# Altium project PCB_TEAM07_SMT.PrjPcb
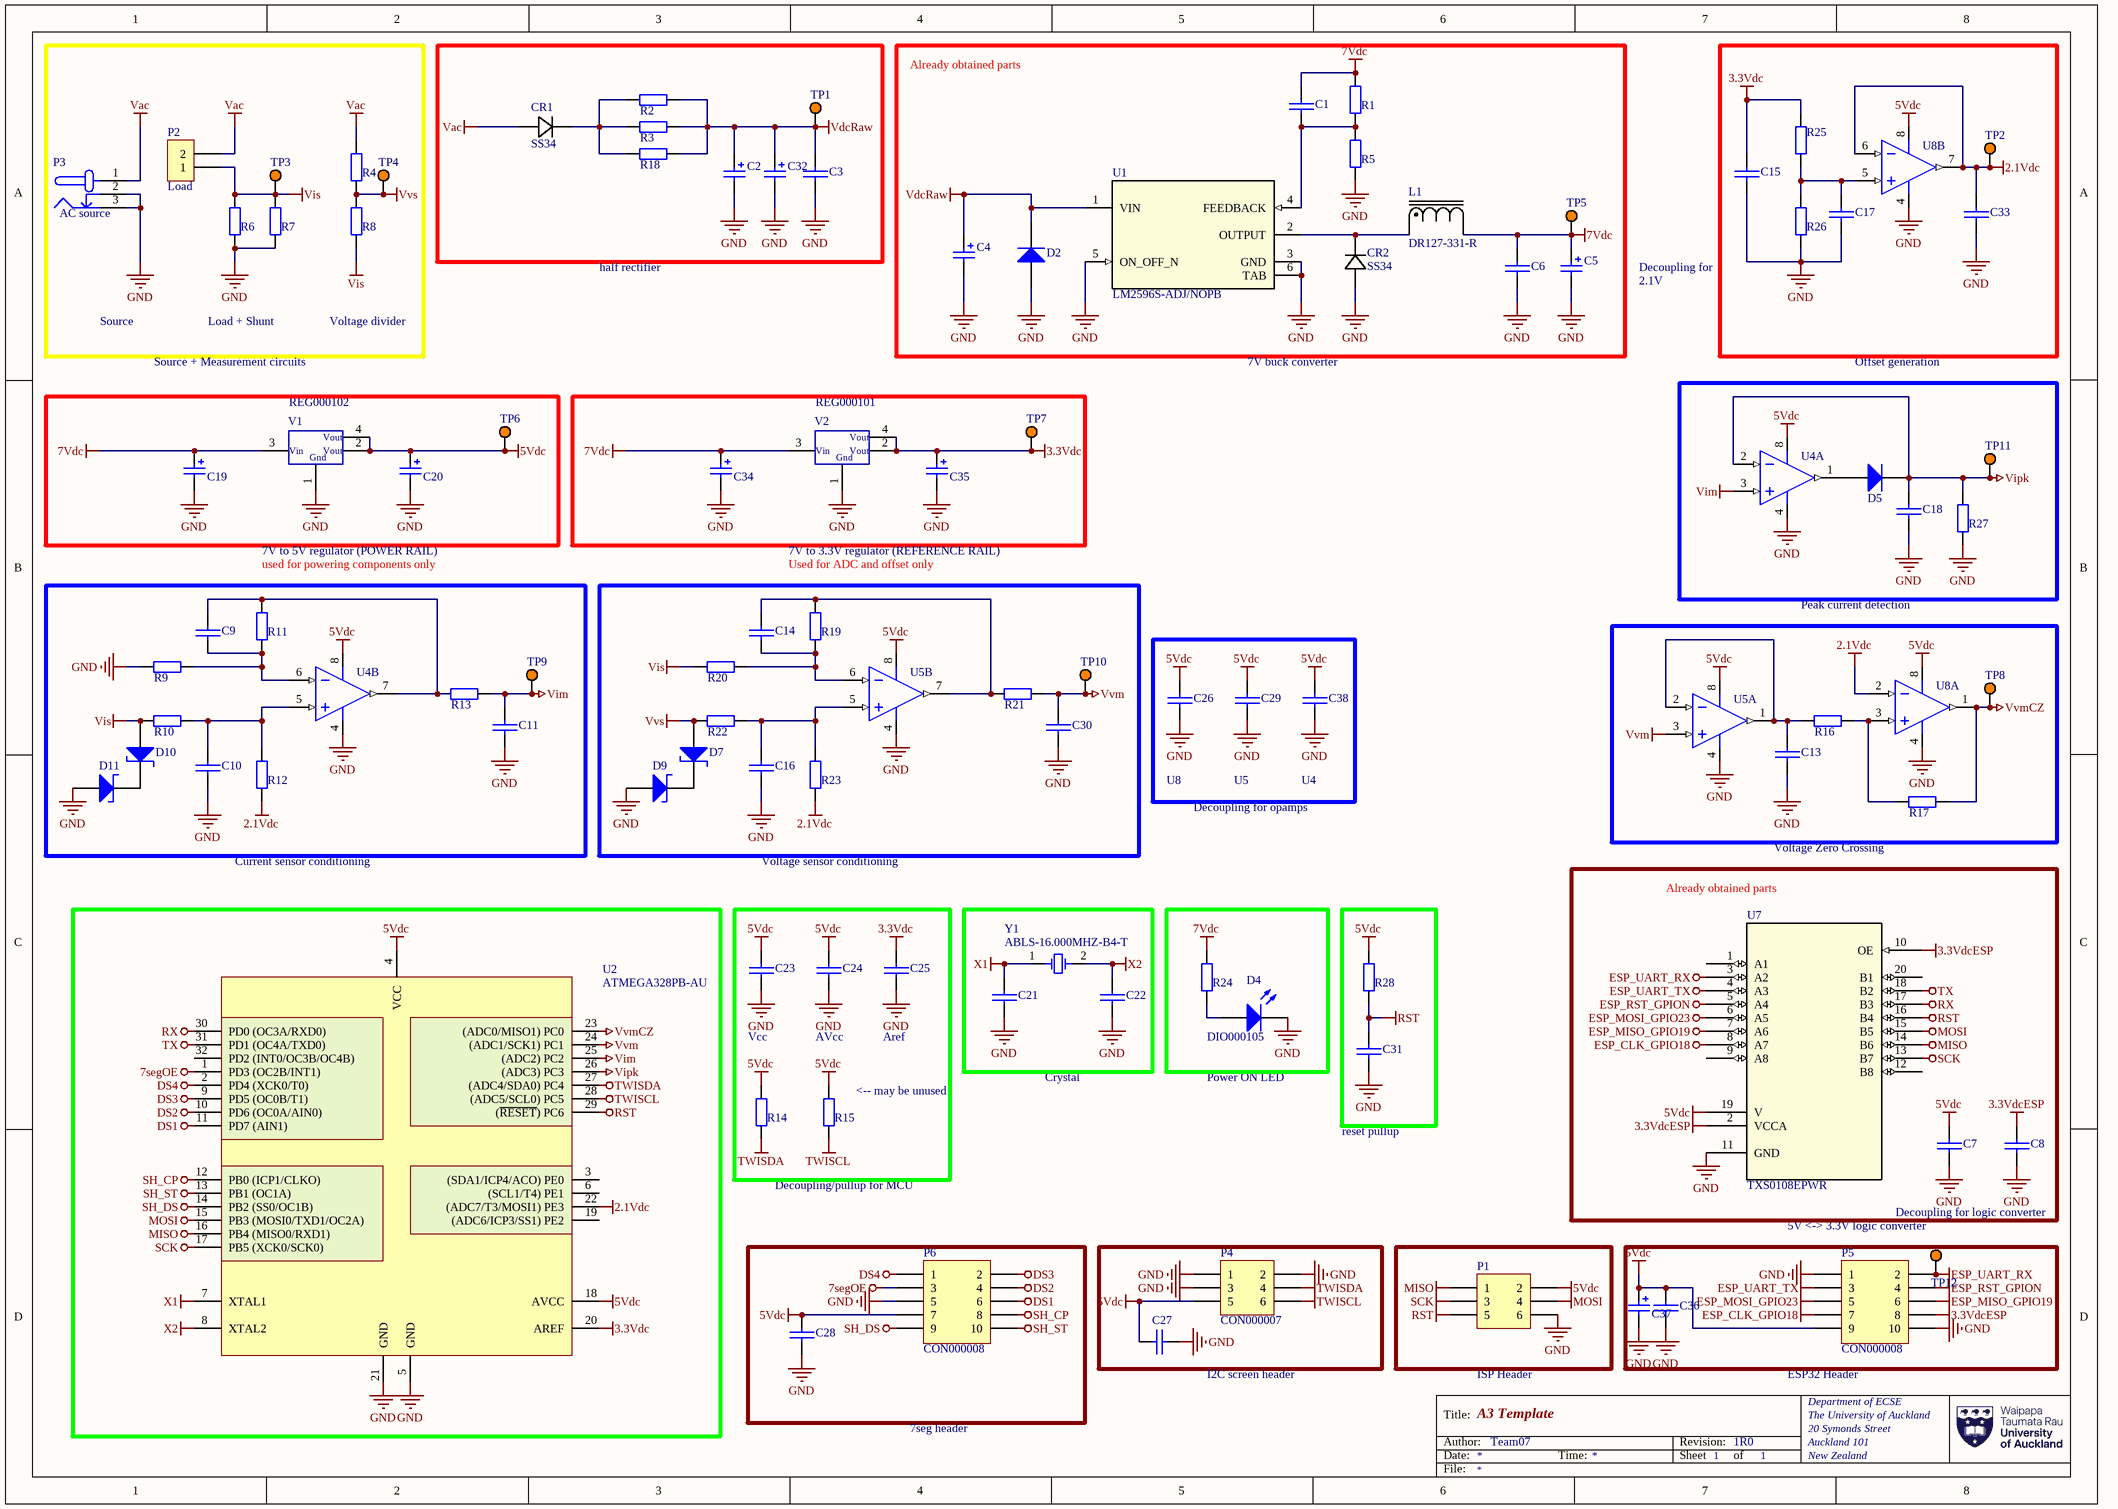
[diagram p0: PCB_TEAM07_SMT_Sch.SchDoc]
1 sheet, 102 parts. Net scope: global (net labels, ports and power ports of the same name join across sheets).
Board file: PCB_TEAM07_SMT_PCB.PcbDoc

## Sheet PCB_TEAM07_SMT_Sch.SchDoc: A3 Template
size A3; Author: Team07; CompanyName: The University of Auckland; Organization: Department of ECSE; Address1: 20 Symonds Street; Address2: Auckland 101; Address3: New Zealand; Revision: 1R0; SheetNumber: 1; SheetTotal: 1

### Parts
C1  CAP000520  [ECE-CAPC2012-0805SM]  (value not drawn)
C2  CAP000307  [ECE-CAPAE10X10.2SM]  (value not drawn)
C3  CAP000524  [ECE-CAPC2012-0805SM]  (value not drawn)
C4  CAP000307  [ECE-CAPAE10X10.2SM]  (value not drawn)
C5  CAP000307  [ECE-CAPAE10X10.2SM]  (value not drawn)
C6  CAP000524  [ECE-CAPC2012-0805SM]  (value not drawn)
C7  CAP000524  [ECE-CAPC2012-0805SM]  (value not drawn)
C8  CAP000524  [ECE-CAPC2012-0805SM]  (value not drawn)
C9  CAP000524  [ECE-CAPC2012-0805SM]  (value not drawn)
C10  CAP000524  [ECE-CAPC2012-0805SM]  (value not drawn)
C11  CAP000524  [ECE-CAPC2012-0805SM]  (value not drawn)
C13  CAP000524  [ECE-CAPC2012-0805SM]  (value not drawn)
C14  CAP000524  [ECE-CAPC2012-0805SM]  (value not drawn)
C15  CAP000524  [ECE-CAPC2012-0805SM]  (value not drawn)
C16  CAP000524  [ECE-CAPC2012-0805SM]  (value not drawn)
C17  CAP000524  [ECE-CAPC2012-0805SM]  (value not drawn)
C18  CAP000524  [ECE-CAPC2012-0805SM]  (value not drawn)
C19  CAP000305  [ECE-CAPAE6.3X5.4SM]  (value not drawn)
C20  CAP000305  [ECE-CAPAE6.3X5.4SM]  (value not drawn)
C21  CAP000524  [ECE-CAPC2012-0805SM]  (value not drawn)
C22  CAP000524  [ECE-CAPC2012-0805SM]  (value not drawn)
C23  CAP000524  [ECE-CAPC2012-0805SM]  (value not drawn)
C24  CAP000524  [ECE-CAPC2012-0805SM]  (value not drawn)
C25  CAP000524  [ECE-CAPC2012-0805SM]  (value not drawn)
C26  CAP000524  [ECE-CAPC2012-0805SM]  (value not drawn)
C27  CAP000524  [ECE-CAPC2012-0805SM]  (value not drawn)
C28  CAP000524  [ECE-CAPC2012-0805SM]  (value not drawn)
C29  CAP000524  [ECE-CAPC2012-0805SM]  (value not drawn)
C30  CAP000524  [ECE-CAPC2012-0805SM]  (value not drawn)
C31  CAP000524  [ECE-CAPC2012-0805SM]  (value not drawn)
C32  CAP000307  [ECE-CAPAE10X10.2SM]  (value not drawn)
C33  CAP000524  [ECE-CAPC2012-0805SM]  (value not drawn)
C34  CAP000305  [ECE-CAPAE6.3X5.4SM]  (value not drawn)
C35  CAP000305  [ECE-CAPAE6.3X5.4SM]  (value not drawn)
C36  CAP000524  [ECE-CAPC2012-0805SM]  (value not drawn)
C37  CAP000305  [ECE-CAPAE6.3X5.4SM]  (value not drawn)
C38  CAP000524  [ECE-CAPC2012-0805SM]  (value not drawn)
CR1  SS34  [DO-214ACSMA2_MDD]
CR2  SS34  [DO-214ACSMA2_MDD]
D2  DIO000102  [ECE-DO214ACSM]  (value not drawn)
D4  DIO000105  [ECE-LED2012-0805SM]
D5  DIO000102  [ECE-DO214ACSM]  (value not drawn)
D7  ZEN000018  [ECE-DIO-SOD123SM]  (value not drawn)
D9  ZEN000018  [ECE-DIO-SOD123SM]  (value not drawn)
D10  ZEN000018  [ECE-DIO-SOD123SM]  (value not drawn)
D11  ZEN000018  [ECE-DIO-SOD123SM]  (value not drawn)
L1  DR127-331-R  [DR127]
P1  CON000007  [ECE-BHDR2X3TH]  (value not drawn)
P2  AC_Output  [Dual Banana Connector-Footprint-1]  (value not drawn)
P3  AC_Input  [Barrel Jack-Footprint-1]  (value not drawn)
P4  CON000007  [ECE-BHDR2X3TH]
P5  CON000008  [ECE-BHDR-2X5TH]
P6  CON000008  [ECE-BHDR-2X5TH]
R1  RES000501  [ECE-RESC2012-0805SM]  (value not drawn)
R2  RES000501  [ECE-RESC2012-0805SM]  (value not drawn)
R3  RES000501  [ECE-RESC2012-0805SM]  (value not drawn)
R4  RES000501  [ECE-RESC2012-0805SM]  (value not drawn)
R5  RES000501  [ECE-RESC2012-0805SM]  (value not drawn)
R6  RES000501  [ECE-RESC2012-0805SM]  (value not drawn)
R7  RES000501  [ECE-RESC2012-0805SM]  (value not drawn)
R8  RES000501  [ECE-RESC2012-0805SM]  (value not drawn)
R9  RES000501  [ECE-RESC2012-0805SM]  (value not drawn)
R10  RES000501  [ECE-RESC2012-0805SM]  (value not drawn)
R11  RES000501  [ECE-RESC2012-0805SM]  (value not drawn)
R12  RES000501  [ECE-RESC2012-0805SM]  (value not drawn)
R13  RES000501  [ECE-RESC2012-0805SM]  (value not drawn)
R14  RES000501  [ECE-RESC2012-0805SM]  (value not drawn)
R15  RES000501  [ECE-RESC2012-0805SM]  (value not drawn)
R16  RES000501  [ECE-RESC2012-0805SM]  (value not drawn)
R17  RES000501  [ECE-RESC2012-0805SM]  (value not drawn)
R18  RES000501  [ECE-RESC2012-0805SM]  (value not drawn)
R19  RES000501  [ECE-RESC2012-0805SM]  (value not drawn)
R20  RES000501  [ECE-RESC2012-0805SM]  (value not drawn)
R21  RES000501  [ECE-RESC2012-0805SM]  (value not drawn)
R22  RES000501  [ECE-RESC2012-0805SM]  (value not drawn)
R23  RES000501  [ECE-RESC2012-0805SM]  (value not drawn)
R24  RES000501  [ECE-RESC2012-0805SM]  (value not drawn)
R25  RES000501  [ECE-RESC2012-0805SM]  (value not drawn)
R26  RES000501  [ECE-RESC2012-0805SM]  (value not drawn)
R27  RES000501  [ECE-RESC2012-0805SM]  (value not drawn)
R28  RES000501  [ECE-RESC2012-0805SM]  (value not drawn)
TP1  Test_Point_TH  [Test-Pin-TH]  (value not drawn)
TP2  Test_Point_TH  [Test-Pin-TH]  (value not drawn)
TP3  Test_Point_TH  [Test-Pin-TH]  (value not drawn)
TP4  Test_Point_TH  [Test-Pin-TH]  (value not drawn)
TP5  Test_Point_TH  [Test-Pin-TH]  (value not drawn)
TP6  Test_Point_TH  [Test-Pin-TH]  (value not drawn)
TP7  Test_Point_TH  [Test-Pin-TH]  (value not drawn)
TP8  Test_Point_TH  [Test-Pin-TH]  (value not drawn)
TP9  Test_Point_TH  [Test-Pin-TH]  (value not drawn)
TP10  Test_Point_TH  [Test-Pin-TH]  (value not drawn)
TP11  Test_Point_TH  [Test-Pin-TH]  (value not drawn)
TP12  Test_Point_TH  [Test-Pin-TH]  (value not drawn)
U1  LM2596S-ADJ/NOPB  [KTT0005B]
U2  ATMEGA328PB-AU  [TQFP-32]
U4  TLC082CDR  [SOIC8-Ti-Footprint]  (value not drawn)  (parts A,B of 2)
U5  TLC082CDR  [SOIC8-Ti-Footprint]  (value not drawn)  (parts A,B of 2)
U7  TXS0108EPWR  [PW20]
U8  TLC082CDR  [SOIC8-Ti-Footprint]  (value not drawn)  (parts A,B of 2)
V1  REG000102  [ECE-SOT223SM]
V2  REG000101  [ECE-SOT223SM]
Y1  ABLS-16.000MHZ-B4-T  [HC49-U-Crystal]

### Blocks framed on the sheet
Already obtained parts: C1 C4-C6 CR2 D2 L1 R1 R5 TP5 U1
Offset generation: C18 D5 R27 TP11 U4
used for powering components only: C9-C11 D10 D11 R9-R13 TP9 U4
Used for ADC and offset only: C14 C16 C30 D7 D9 R19-R23 TP10 U5
Peak current detection: C13 R16 R17 TP8 U5 U8
5V <-> 3.3V logic converter: C36 C37 P5 TP12

### Nets
2.1Vdc: C33.1 R12.1 R23.1 TP2.1 U2.22((ADC7/T3/MOSI1)_PE3) U8.2(1IN-) U8.6(2IN-) U8.7(2OUT)
3.3Vdc: C15.1 C25.1 C35.1 R25.1 TP7.1 U2.20(AREF) V2.2(Vout) V2.4(Vout)
3.3VdcESP: C8.1 P5.8 U7.2(VCCA) U7.10(OE)
5Vdc: C7.1 C20.1 C23.1 C24.1 C26.1 C27.1 C28.1 C29.1 C36.1 C37.1 C38.1 P1.2 P4.5 P5.9 P6.7 R14.2 R15.2 R28.2 TP6.1 U2.4(VCC) U2.18(AVCC) U4.8(VCC) U5.8(VCC) U7.19(V) U8.8(VCC) V1.2(Vout) V1.4(Vout)
7segOE: P6.3 U2.1(PD3_(OC2B/INT1))
7Vdc: C1.1 C5.1 C6.1 C19.1 C34.1 L1.2 R1.2 R24.2 TP5.1 V1.3(Vin) V2.3(Vin)
DS1: P6.6 U2.11(PD7_(AIN1))
DS2: P6.4 U2.10(PD6_(OC0A/AIN0))
DS3: P6.2 U2.9(PD5_(OC0B/T1))
DS4: P6.1 U2.2(PD4_(XCK0/T0))
ESP_CLK_GPIO18: P5.7 U7.8(A7)
ESP_MISO_GPIO19: P5.6 U7.7(A6)
ESP_MOSI_GPIO23: P5.5 U7.6(A5)
ESP_RST_GPION: P5.4 U7.5(A4)
ESP_UART_RX: P5.2 TP12.1 U7.3(A2)
ESP_UART_TX: P5.3 U7.4(A3)
GND: C2.2 C3.2 C4.2 C5.2 C6.2 C7.2 C8.2 C10.2 C11.2 C13.2 C15.2 C16.2 C17.2 C18.2 C19.2 C20.2 C21.2 C22.2 C23.2 C24.2 C25.2 C26.2 C27.2 C28.2 C29.2 C30.2 C31.2 C32.2 C33.2 C34.2 C35.2 C36.2 C37.2 C38.2 CR2.2 D2.1(A) D4.2(K) D9.1(A) D11.1(A) P1.6 P3.2(GND_ALT) P3.3(GND) P4.1 P4.2 P4.3 P5.1 P5.10 P6.5 R5.1 R6.2 R7.1 R9.2 R26.1 R27.1 U1.3(GND) U1.5(ON_OFF_N) U1.6(TAB) U2.5(GND) U2.21(GND) U4.4(GND) U5.4(GND) U7.11(GND) U8.4(GND) V1.1(Gnd) V2.1(Gnd)
MISO: P1.1 U2.16(PB4_(MISO0/RXD1)) U7.14(B6)
MOSI: P1.4 U2.15(PB3_(MOSI0/TXD1/OC2A)) U7.15(B5)
RST: C31.1 P1.5 R28.1 U2.29((~{RESET})_PC6) U7.16(B4)
RX: U2.30(PD0_(OC3A/RXD0)) U7.17(B3)
SCK: P1.3 U2.17(PB5_(XCK0/SCK0)) U7.13(B7)
SH_CP: P6.8 U2.12(PB0_(ICP1/CLKO))
SH_DS: P6.9 U2.14(PB2_(SS0/OC1B))
SH_ST: P6.10 U2.13(PB1_(OC1A))
TWISCL: P4.6 R15.1 U2.28((ADC5/SCL0)_PC5)
TWISDA: P4.4 R14.1 U2.27((ADC4/SDA0)_PC4)
TX: U2.31(PD1_(OC4A/TXD0)) U7.18(B2)
Vac: CR1.2 P2.2 P3.1(VCC) R4.2
VdcRaw: C2.1 C3.1 C4.1 C32.1 D2.2(K) R2.1 R3.1 R18.1 TP1.1 U1.1(VIN)
Vim: C11.1 R13.1 TP9.1 U2.25((ADC2)_PC2) U4.3(1IN+)
Vipk: C18.1 D5.2(K) R27.2 TP11.1 U2.26((ADC3)_PC3) U4.2(1IN-)
Vis: D10.1(A) P2.1 R6.1 R7.2 R8.1 R10.2 R20.2 TP3.1
Vvm: C30.1 R21.1 TP10.1 U2.24((ADC1/SCK1)_PC1) U5.3(1IN+)
VvmCZ: R17.1 TP8.1 U2.23((ADC0/MISO1)_PC0) U8.1(1OUT)
Vvs: D7.1(A) R4.1 R8.2 R22.2 TP4.1
X1: C21.1 U2.7(XTAL1) Y1.1(OSC1)
X2: C22.1 U2.8(XTAL2) Y1.2(OSC2)
NetC1_2: C1.2 R1.1 R5.2 U1.4(FEEDBACK)
NetC9_1: C9.1 R11.2 R13.2 U4.7(2OUT)
NetC9_2: C9.2 R9.1 R11.1 U4.6(2IN-)
NetC10_1: C10.1 R10.1 R12.2 U4.5(2IN+)
NetC13_1: C13.1 R16.2 U5.1(1OUT) U5.2(1IN-)
NetC14_1: C14.1 R19.2 R21.2 U5.7(2OUT)
NetC14_2: C14.2 R19.1 R20.1 U5.6(2IN-)
NetC16_1: C16.1 R22.1 R23.2 U5.5(2IN+)
NetC17_1: C17.1 R25.2 R26.2 U8.5(2IN+)
NetCR1_1: CR1.1 R2.2 R3.2 R18.2
NetCR2_1: CR2.1 L1.1 U1.2(OUTPUT)
NetD4_1: D4.1(A) R24.1
NetD5_1: D5.1(A) U4.1(1OUT)
NetD7_2: D7.2(K) D9.2(K)
NetD10_2: D10.2(K) D11.2(K)
NetR16_1: R16.1 R17.2 U8.3(1IN+)

Not connected (* = marked no-connect by the designer): U2 3((SDA1/ICP4/ACO)_PE0) 6((SCL1/T4)_PE1) 19((ADC6/ICP3/SS1)_PE2) 32(PD2_(INT0/OC3B/OC4B)); U7 1(A1) 9(A8) 12(B8) 20(B1)

### Notes on the sheet
- (near P3) AC source
- (near P2) Load
- half rectifier
- Decoupling for
- 2.1V
- Source
- Source + Measurement circuits
- Load + Shunt
- Voltage divider
- 7V buck converter
- 7V to 5V regulator (POWER RAIL)
- 7V to 3.3V regulator (REFERENCE RAIL)
- U8
- U5
- U4
- Decoupling for opamps
- (near R17) Voltage Zero Crossing
- Current sensor conditioning
- Voltage sensor conditioning
- Already obtained parts
- Vcc
- AVcc
- Aref
- (near R15) <-- may be unused
- Crystal
- Power ON LED
- Decoupling/pullup for MCU
- reset pullup
- Decoupling for logic converter
- I2C screen header
- ISP Header
- (near P5) ESP32 Header
- 7seg header
- Title:
- Author:
- Date:
- Time:
- Revision:
- Sheet
- of
- File:

### Library data of the parts
C1 = CMP-039-000133-1: CAP CER 22nF 50V X7R SM0805; Manufacturer-PN: CL21B223KBANNNC; Manufactuer: Samsung; Path: ece/ts/Lists/Stock Inventory; Item Type: Item; Assembly Method: Surface Mount; Supplier1: Digikey; Value: 22nF; Component Type: CAP-0805-22nF; Status: Active; Category: Capacitor; Voltage/Current: 50V; UoA Stock#: CAP000520; Supplier1-PN: 1276-1081-2-ND; Size/Package: 0805 (2012 Metric)
C2 C4 C5 C32 = CMP-039-000113-1: CAP 220uF 25V ELE SM; Manufactuer: Nichicon; Manufacturer-PN: UWX1C101MCL1GB; Assembly Method: Surface Mount; Item Type: Item; Path: ece/ts/Lists/Stock Inventory; Voltage/Current: 25V; Size/Package: 10 X 10.2; Datasheet Link: http://share.engineering.auckland.ac.nz/ece/ts/Student%20Documents/SMT-Ecaps-e-wx.pdf; Value: 220uF; Supplier1: Digikey; Component Type: CAP-10X10.2-220uF-25V; UoA Stock#: CAP000307; Supplier1-PN: 493-2105-2-ND; Status: Active; Category: Capacitor
C3 C6-C11 C13-C18 C21-C31 C33 C36 C38 = CMP-039-000137-1: CAP CER 100nF 50V X7R SM0805; Manufactuer: Samsung; Manufacturer-PN: CL21B104KBCNNNC; Item Type: Item; Path: ece/ts/Lists/Stock Inventory; Assembly Method: Surface Mount; Status: Active; Voltage/Current: 50V; Value: 100nF; UoA Stock#: CAP000524; Supplier1: Digikey; Supplier1-PN: 276-1003-2-ND; Category: Capacitor; Component Type: CAP-0805-100nF; Size/Package: 0805 (2012 Metric)
C19 C20 C34 C35 C37 = CMP-039-000111-1: CAP 47uF 16V ELE SM; Manufacturer-PN: UWT1C470MCL1GB; Manufactuer: Nichicon; Item Type: Item; Assembly Method: Surface Mount; Path: ece/ts/Lists/Stock Inventory; Datasheet Link: http://share.engineering.auckland.ac.nz/ece/ts/Student%20Documents/SMT-Ecaps-e-wt.pdf; Status: Active; Value: 47uF; Supplier1-PN: 493-2176-2-ND; Size/Package: 6.3 X 5.4; Supplier1: Digikey; Voltage/Current: 16V; UoA Stock#: CAP000305; Category: Capacitor; Component Type: CAP-6.3X5.4-47uF-16V
CR1 CR2 = SS34: Description; Manufacturer_Name: Microdiode Electronics; Copyright: Copyright (C) 2026 Ultra Librarian. All rights reserved.; Manufacturer_Part_Number: SS34
D2 D5 = CMP-043-000008-1: Diode Rectifier 1N4007 SM; Manufacturer-PN: CGRA4007-G; Manufactuer: Comchip Technology; Voltage/Current: 1A 1KV; Value: CGRA4007-G; Item Type: Item; Assembly Method: Surface Mount; Path: ece/ts/Lists/Stock Inventory; Datasheet Link: http://share.engineering.auckland.ac.nz/ece/ts/Student%20Documents/Diode-CGRA4001-G.pdf; UoA Stock#: DIO000102; Category: Diode; Component Type: DO214-4007; Size/Package: DO-214; Supplier1-PN: 641-1018-2-ND; Status: Active; Supplier1: Digikey
D4 = CMP-043-000011-1: LED RED ORANGE CLEAR 0805 SMD; Manufactuer: Lite-On Inc; Voltage/Current: 20mA; Path: ece/ts/Lists/Stock Inventory; Value: LTST-C170KAKT; Assembly Method: Surface Mount; Item Type: Item; Status: Active; Component Type: LED-0805-RED; Supplier1: Digikey; Datasheet Link: http://share.engineering.auckland.ac.nz/ece/ts/Student%20Documents/LED-S_110_LTST-C170KAKT.pdf; Supplier1-PN: 160-1412-6-ND; Size/Package: 0805 (2012 Metric); UoA Stock#: DIO000105; Manufacturer-PN: LTST-C170KAKT; Category: Diode
D7 D9-D11 = CMP-055-000017-1: 4.7V Zener Diodes SM; Manufactuer: NXP Semiconductors; Item Type: Item; Assembly Method: Surface Mount; Path: ece/ts/Lists/Stock Inventory; Value: BZT52H-B4V7,115; Size/Package: SOD-123; Supplier1: Digikey; Voltage/Current: 4.7V; Category: Zener; Manufacturer-PN: BZT52H-B4V7,115; UoA Stock#: ZEN000018; Status: Active; Supplier1-PN: 568-11146-1-ND
L1 = DR127-331-R: Description; Manufacturer_Name: Eaton; Copyright: Copyright (C) 2026 Ultra Librarian. All rights reserved.; Manufacturer_Part_Number: DR127-331-R
P1 P4 = CMP-042-000000-1: IDC PLUG 6 WAY TH; Manufacturer-PN: 71600-006LF; Manufactuer: FCI; Assembly Method: Through hole; Item Type: Item; Path: ece/ts/Lists/Stock Inventory; Value: 3 X 2 IDC; Size/Package: 2.54 Radial; Supplier1: Digikey; Datasheet Link: http://share.engineering.auckland.ac.nz/ece/ts/Student%20Documents/IDC-6way.pdf; Category: Connector; UoA Stock#: CON000007; Supplier1-PN: 609-2841-ND; Component Type: NA; Status: Active
P2 = CMP-002-00001-1: Dual Banan connector
P3 = CMP-002-00000-1: Barrel jack
P5 P6 = CMP-042-000001-1: IDC PLUG 10 WAY TH; Manufacturer-PN: YRNW10; Manufactuer: Mantech; Value: 5 X 2 IDC; Path: ece/ts/Lists/Stock Inventory; Item Type: Item; Assembly Method: Through hole; Category: Connector; Supplier1-PN: YRNW10; Supplier1: Elecon; Component Type: NA; UoA Stock#: CON000008; Size/Package: 2.54 pitch; Status: Active; Datasheet Link: http://share.engineering.auckland.ac.nz/ece/ts/Student%20Documents/IDC-box%20headers.pdf
R1-R28 = CMP-052-000171-1: RES CER 0R 2012 SM; Path: ece/ts/Lists/Stock Inventory; Voltage/Current: 1/8W; Item Type: Item; Assembly Method: Surface Mount; Value: 0; UoA Stock#: RES000501; Status: Active; Category: Resistor; Size/Package: 2012; Component Type: RES-2012-0R
TP1-TP12 = CMP-002-00002-1: Test pin TH generic
U1 = LM2596S-ADJNOPB: SIMPLE SWITCHER&reg; 4.5V to 40V, 3A Low Component Count Step-Down Regulator 5-DDPAK/TO-263 -40 to 125; Manufacturer_Name: Texas Instruments; PartNumber: LM2596SX-ADJ/NOPB; CompType: IC; TYPE: TYPE; RefDes: RefDes; Copyright: Copyright (C) 2025 Ultra Librarian. All rights reserved.; Manufacturer_Part_Number: LM2596S-ADJ/NOPB; Alternate_PartNumber: LM2596S-ADJ/NOPB; PackageReference: KTT0005B; MountType: SMT; RoHS: Y; Manufacturer: Texas Instruments
U2 = CMP-00019-1: AVR 32KB Flash, 1KB EEPROM, 2KB Ram, 20MHZ, TQFP; Number of I/Os: 27; Operating Supply Voltage: 5V; Case/Package: TQFP; RAM Size: 2kB; Clock Frequency: 20MHz; Pins: 32
U4 U5 U8 = CMP-001-0003-1: Dual 3pA 19V/us 10MHz 1900uV SOIC-8 Operational Amplifier; Common Mode Rejection Ratio: 80dB; Max Supply Voltage: 16V; Number of Amplifiers: 2; Output Current: 57mA; Input Bias Current: 50pA; Input Offset Voltage (Vos): 1.9mV; Slew Rate: 16V/µs; Gain Bandwidth Product: 10MHz; Bandwidth: 10MHz; Case/Package: SOIC
U7 = TXS0108EPWR: Eight-bit bidirectional voltage-level shifter for open-drain and push-pull applications 20-TSSOP -40 to 85; Manufacturer_Name: Texas Instruments; Copyright: Copyright (C) 2025 Ultra Librarian. All rights reserved.; Manufacturer_Part_Number: TXS0108EPWR; RefDes: RefDes; Type: Type
V1 = CMP-051-000003-1: IC REG LDO 5V 0.8A SOT223SM; Manufacturer-PN: LD1117S50CTR; Manufactuer: STMicroelectronics; Voltage/Current: 5V/800mA; Value: LD1117S33CTR; Item Type: Item; Assembly Method: Surface Mount; Path: ece/ts/Lists/Stock Inventory; Component Type: REG-SOT223-LD5V; Supplier1-PN: 497-1243-6-ND; UoA Stock#: REG000102; Status: Active; Datasheet Link: http://share.engineering.auckland.ac.nz/ece/ts/Student%20Documents/LD1117.pdf; Size/Package: SOT223; Category: Regulator; Supplier1: Digikey
V2 = CMP-051-000002-1: IC REG LDO 3.3V 0.8A SOT223SM; Manufactuer: STMicroelctronics; Assembly Method: Surface Mount; Value: LD1117S33CTR; Voltage/Current: 3.3V/800mA; Path: ece/ts/Lists/Stock Inventory; Item Type: Item; Size/Package: SOT223; Datasheet Link: http://share.engineering.auckland.ac.nz/ece/ts/Student%20Documents/LD1117.pdf; Status: Active; Component Type: REG-SOT223-LD3.3; UoA Stock#: REG000101; Manufacturer-PN: LD1117S33CTR; Supplier1-PN: 497-1241-6-ND; Category: Regulator; Supplier1: Digikey
Y1 = CMP-00025-1: Crystal 16MHz ±30ppm (Tol) ±50ppm (Stability) 18pF FUND 40Ohm 2-Pin HC-49/US SMD T/R; Frequency Tolerance: 0.003%; Frequency Stability: 50ppm; Case/Package: HC-49/US; Frequency: 16MHz